# Altium schematic sheet Type_C_Port.SchDoc
size A2; Date: Not shown in title block; ApprovedBy: Not shown in title block; CheckedBy: Not shown in title block; Author: Not shown in title block; CompanyName: Not shown in title block; Engineer: Not shown in title block; Organization: Not shown in title block; Address1: Not shown in title block; Address2: Not shown in title block; Address3: Not shown in title block; Address4: Not shown in title block; DocumentNumber: 2; Revision: Use project parameter SCH_Rev; SheetNumber: 2; SheetTotal: 3; PageSetup: Record=PageOptions|CenterHorizontal=True|CenterVertical=True|PrintScale=1.00|XCorrection=1.00|YCorrection=1.00|PrintKind=0|BorderSize=5000000|LeftOffset=0|BottomOffset=0|Orientation=2|PaperLength=1000|PaperWidth=1000|Scale=100|PaperSource=15|PrintQuality=600|MediaType=1|DitherType=10|PaperKind=Letter|PrintScaleMode=1; CurrentTime: Not shown in title block; CurrentDate: Not shown in title block; Time: Not shown in title block; DocumentFullPathAndName: Not shown in title block; DocumentName: Not shown in title block; ModifiedDate: Not shown in title block; ImagePath: Not shown in title block
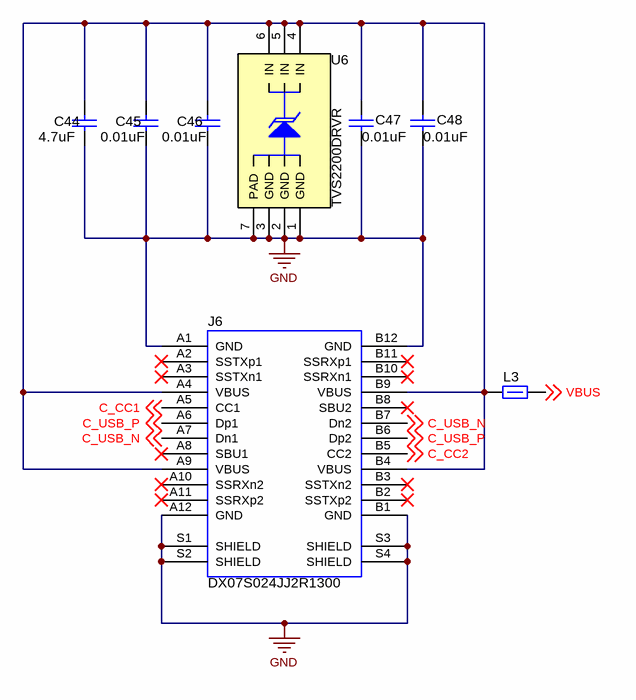
[diagram p0: Type_C_Port.SchDoc]

## Parts
C44  ValueDisplayed: 4.7uF  [0603]  (hidden comment: GRM188R6YA475KE15D)
C45  ValueDisplayed: 0.01uF  [0402]  (hidden comment: C0402C103J5RACTU)
C46  ValueDisplayed: 0.01uF  [0402]  (hidden comment: C0402C103J5RACTU)
C47  ValueDisplayed: 0.01uF  [0402]  (hidden comment: C0402C103J5RACTU)
C48  ValueDisplayed: 0.01uF  [0402]  (hidden comment: C0402C103J5RACTU)
J6  DX07S024JJ2R1300  [JAE_DX07S024JJ2R1300]
L3  FBMJ2125HM210NT  [0805_HV]  (value not drawn)
U6  TVS2200DRVR  [DRV0006A]

## Nets
GND: C44.2 C45.1 C46.1 C47.1 C48.1 J6.A1(GND) J6.A12(GND) J6.B1(GND) J6.B12(GND) J6.S1(SHIELD) J6.S2(SHIELD) J6.S3(SHIELD) J6.S4(SHIELD) U6.1(GND) U6.2(GND) U6.3(GND) U6.7(PAD)
C_CC1: J6.A5(CC1) ; off-sheet C_CC1
C_CC2: J6.B5(CC2) ; off-sheet C_CC2
C_USB_N: J6.A7(Dn1) J6.B7(Dn2) ; off-sheet C_USB_N
C_USB_P: J6.A6(Dp1) J6.B6(Dp2) ; off-sheet C_USB_P
VBUS: L3.2 ; off-sheet VBUS
NetC44_1: C44.1 C45.2 C46.2 C47.2 C48.2 J6.A4(VBUS) J6.A9(VBUS) J6.B4(VBUS) J6.B9(VBUS) L3.1 U6.4(IN) U6.5(IN) U6.6(IN)

Not connected (* = marked no-connect by the designer): J6 A2(SSTXp1)* A3(SSTXn1)* A8(SBU1)* A10(SSRXn2)* A11(SSRXp2)* B2(SSTXp2)* B3(SSTXn2)* B8(SBU2)* B10(SSRXn1)* B11(SSRXp1)*

## Notes on the sheet
- Orderable:
- Designed for:
- Mod. Date:
- Texas Instruments and/or its licensors do not warrant the accuracy or completeness of this specification or any information contained therein. Texas Instruments and/or its licensors do not warrant that this design will meet the specifications, will be suitable for your application or fit for any particular purpose, or will operate in an implementation. Texas Instruments and/or its licensors do not warrant that the design is production worthy. You should completely validate and test your design implementation to confirm the system functionality for your application.
- Drawn By:
- Engineer:
- SVN Rev:
- Number:
- TID #:
- Rev:
- Sheet Title:
- File:
- Contact:
- Project Title:
- Assembly Variant:
- Sheet:
- Size:
- of
- A2
- © Texas Instruments
- http://www.ti.com

## Library data of the parts
C44 = CMP-0007357-5: CAP, CERM, 4.7 uF, 35 V, +/- 10%, X5R, 0603; Manufacturer: MuRata; TaMin_C: -55°C; Polarized: N; SizeAreaWB_mm2: 4.68; Value1: Unknown; U/M: EA; Value: 4.7uF; TaMax_C: 85°C; SizeZ_mm: 1; SizeX_mm: 1.6; SizeY_mm: 0.8; Value2: 35V; SizeArea_mm2: 1.28; Cap_F: 4.7µF; AEC Category: Q200; Supplier Part Number 2: 68X2784; Publisher: Texas Instruments; Supplier 2: Newark; Supplier Part Number 3: 81-GRM188R6YA475KE5D; TempCo: X5R; Supplier 3: Mouser; Published: 2008-06-19; RoHS: Y; MountType: SMT; Supplier 1: Digi-Key; PackageReference: 0603; Tolerance_%: 10%; Cap_Case: 0603; CompType: Capacitor; LatestRevisionDate: 2017-03-09; PartNumber: GRM188R6YA475KE15D; AEC Qualified: ?; ComponentLink1Description: Datasheet link; Supplier Part Number 1: 490-7205-1-ND; Technology: Ceramic; ComponentLink1URL: http://psearch.murata.com/capacitor/product/GRM188R6YA475KE15%23.pdf
C45-C48 = CMP-0006236-2: CAP, CERM, 0.01 uF, 50 V, +/- 5%, X7R, 0402; Manufacturer: Kemet; TaMin_C: -55°C; Polarized: N; SizeAreaWB_mm2: 3; Value1: Unknown; U/M: EA; Value: 0.01uF; TaMax_C: 125°C; SizeZ_mm: 0.6; SizeX_mm: 1; SizeY_mm: 0.5; Value2: 50V; Cap_F: 10nF; AEC Category: Q200; Supplier Part Number 2: 57J0044; Publisher: Texas Instruments; Supplier 2: Newark; Supplier Part Number 3: 80-C0402C103J5R; TempCo: X7R; Supplier 3: Mouser; Published: 2008-06-19; RoHS: Y; MountType: SMT; Supplier 1: Digi-Key; PackageReference: 0402; Tolerance_%: 5%; Cap_Case: 0402; SizeArea_mm2: 0.5; CompType: Capacitor; LatestRevisionDate: 2017-03-09; PartNumber: C0402C103J5RACTU; AEC Qualified: ?; ComponentLink1Description: Datasheet link; Supplier Part Number 1: 399-7758-1-ND; Technology: Ceramic; ComponentLink1URL: http://www.kemet.com/Lists/ProductCatalog/Attachments/53/KEM_C1002_X7R_SMD.pdf
J6 = CMP-0085712-2: Receptacle, USB 3.1 Type C, R/A, Gold, SMT; Manufacturer: JAE Electronics; Current_A: 1.25A; Gender: Female; Voltage_V: 20V; Pitch_mm: 0.5; Row_Count: 2; ComponentLink1Description: Datasheet URL; CompType: USB; ComponentLink1URL: http://www.jae.com/z-en/pdf_download_exec.cfm?param=SJ115946.pdf; PinCount: 24; ContactFinish: Gold; PartNumber: DX07S024JJ2R1300; MountType: SMT; PackageReference: Receptacle, USB 3.1 Type C, R/A, SMT; Orientation: R/A; Color: Black; RoHS: Y
L3 = CMP-0003375-1: Ferrite Bead, 21 ohm @ 100 MHz, 6 A, 0805; Manufacturer: Taiyo Yuden; ZTyp@100MHz_Ohm: 21; SizeAreaWB_mm2: 6.75; DCR_ohm: 4m; Value1: 0.004 ohm; Value: 21 ohm; Imax_A: 6A; SizeZ_mm: 1.45; SizeX_mm: 2; SizeY_mm: 1.25; SizeArea_mm2: 2.5; ComponentLink1URL: http://www.yuden.co.jp/us/product/pdf/efbm_e.pdf; Publisher: Texas Instruments; Published: 2014-04-30; RoHS: Y; MountType: SMT; Supplier 1: Digi-Key; PackageReference: 0805; Value2: 6A; CompType: Ferrite Bead; LatestRevisionDate: 2017-03-09; PartNumber: FBMJ2125HM210NT; ComponentLink1Description: Datasheet link; Supplier Part Number 1: 587-1765-1-ND; ValueDisplayed: 21 ohm
U6 = CMP-0077834-1: 22-V Precision Surge Protection Clamp, DRV0006A (WSON-6); Alternate Manufacturer: Texas Instruments; SizeAreaWB_mm2: 9.0; SizeZ_mm: 0.8; SizeX_mm: 2.0; SizeArea_mm2: 4.0; CompType: IC; AEC Qualified: N; AEC Category: Q200; ComponentLink1URL: http://www.ti.com/lit/ds/symlink/tvs3300.pdf; PackageDescription: WSON-6; MountType: SMT; ComponentLink2URL: TBD; ComponentLink2Description: Product Folder; Manufacturer: Texas Instruments; PackageReference: DRV0006A; SizeY_mm: 2.0; PartNumber: TVS2200DRVR; ComponentLink1Description: Datasheet Link